# Altium project V3-BAT-HV-001.PrjPcb
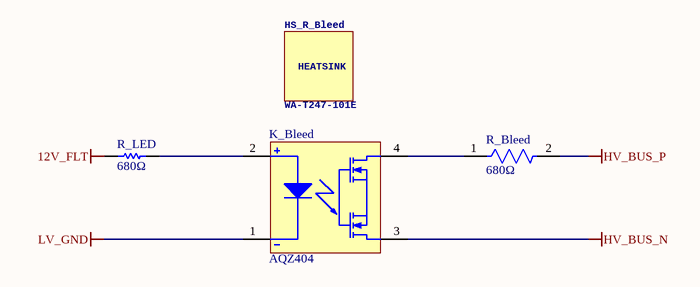
[diagram p0: V3-BAT-HV-001.SchDoc]
1 sheet, 4 parts. Net scope: global (net labels, ports and power ports of the same name join across sheets).

## Sheet V3-BAT-HV-001.SchDoc
size A; SheetNumber: 2; SheetTotal: 2

### Parts
HS_R_Bleed  WA-T247-101E  [OHMITE_WA-T247-101E]
K_Bleed  AQZ404  [PNSC-SIL4_V]
R_Bleed  680Ω  [FP-TEH100-MFG]
R_LED  680Ω  [RESC3225X60X45LL20T20]

### Nets
12V_FLT: R_LED.1
HV_BUS_N: K_Bleed.3
HV_BUS_P: R_Bleed.2
LV_GND: K_Bleed.1(-)
NetK_Bleed_2: K_Bleed.2(+) R_LED.2
NetK_Bleed_4: K_Bleed.4 R_Bleed.1

### Notes on the sheet
- (in symbol HEATSINK_OHMITE_WA-T247-101E) HEATSINK

### Library data of the parts
HS_R_Bleed = HEATSINK_OHMITE_WA-T247-101E: Heat Sink, 11ohm, Extruded, Clip, Longitudinal, Aluminum Alloy, Anodized; Manufacturer: Ohmite; Supplier 1: Digikey; Supplier Part Number 1: WA-T247-101E-ND; Manufacturer Part Number: WA-T247-101E; ComponentLink1Description: Datasheet; ComponentLink1URL: https://www.ohmite.com/assets/images/sink-w.pdf
K_Bleed = CMP-1346-00024-1: PhotoMOS Power 1 Form B, 400 V Load Voltage, 0.5 A Continuous Load Current, -40 to 85 degC, 4-Pin SIL, Carton, RoHS; Manufacturer: Panasonic; Continuous Load Current: 0.5 A; Load Voltage: 400 V; On Resistance (Typ): 2.8 Ohm; Pb-Free: True; Packing: Carton; PartNumber: AQZ404; Series: PhotoMOS Power 1 Form B; RoHS: True; ComponentLink3Description: Package Specification; DatasheetVersion: 201404-T; ComponentLink1URL: http://www3.panasonic.biz/ac/ae/index.jsp; ComponentLink2URL: http://www3.panasonic.biz/ac/e_download/control/relay/photomos/catalog/semi_eng_pwr1b_aqz40.pdf?f_cd=301392; PackageVersion: ASCTB67E, 04/2014; ComponentLink1Description: Manufacturer URL; ComponentLink3URL: http://www3.panasonic.biz/ac/e_download/control/relay/photomos/catalog/semi_eng_dimensions.pdf?f_cd=401560; ComponentLink2Description: Datasheet; Mounting Technology: Through Hole; PackageReference: SIL4; PackageDescription: 4-Pin Through Hole Terminal Package, Body 21 x 3.5 mm
R_Bleed = CMP-00273-12698265-1: TEH100M680RJE: 680Ω, 100 W, ±5%, TO-247 through-hole; Manufacturer: Ohmite; Lead Diameter: 1.67mm; Max Power Dissipation: 100W; Temperature Coefficient: 50ppm/°C; Voltage Rating: 350V; Min Operating Temperature: 25°C; Width: 4.953mm; Lead Pitch: 10.42mm; Terminal Pitch: 10.42mm; Termination: Radial; Length: 15.748mm; Height: 20.955mm; RoHS: Compliant; Number of Terminations: 2; Case/Package: TO-247; Depth: 5.21mm; Mount: Through Hole; Number of Pins: 2; Tolerance: 5%; Power Rating: 100W; Max Operating Temperature: 175°C; Composition: Thick Film; Resistance: 680Ω; Features: Moisture Resistant; NexarPartId: 12698265; Voltage Rating (DC): 350V; Packaging: Bulk; REACH SVHC: Unknown; Manufacturer Part Number: TEH100M680RJE; Supplier 1: Digikey; Supplier Part Number 1: TEH100M680RJE-ND
R_LED = CMP-2005-00104-1: RES 680 OHM 1% 1/2W 1210; Manufacturer: Vishay Dale; Manufacturer Part Number: CRCW1210680RFKEA